# Altium schematic sheet 30_Actuadores.SchDoc
size A4; SheetNumber: 4; SheetTotal: 6
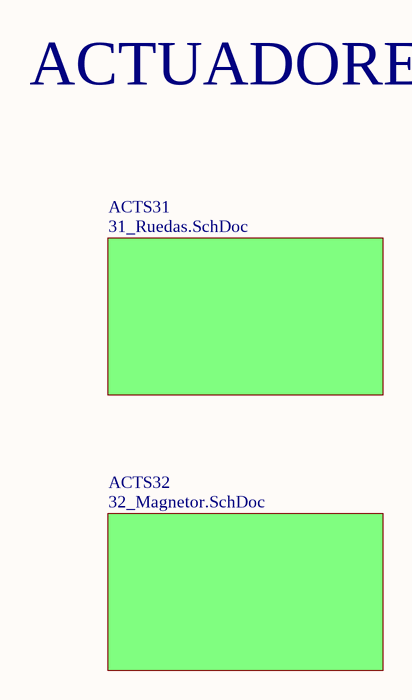
[diagram p0: 30_Actuadores.SchDoc]

## Sub-sheets
ACTS31 = 31_Ruedas.SchDoc: no entries
ACTS32 = 32_Magnetor.SchDoc: no entries

## Notes on the sheet
- ACTUADORES